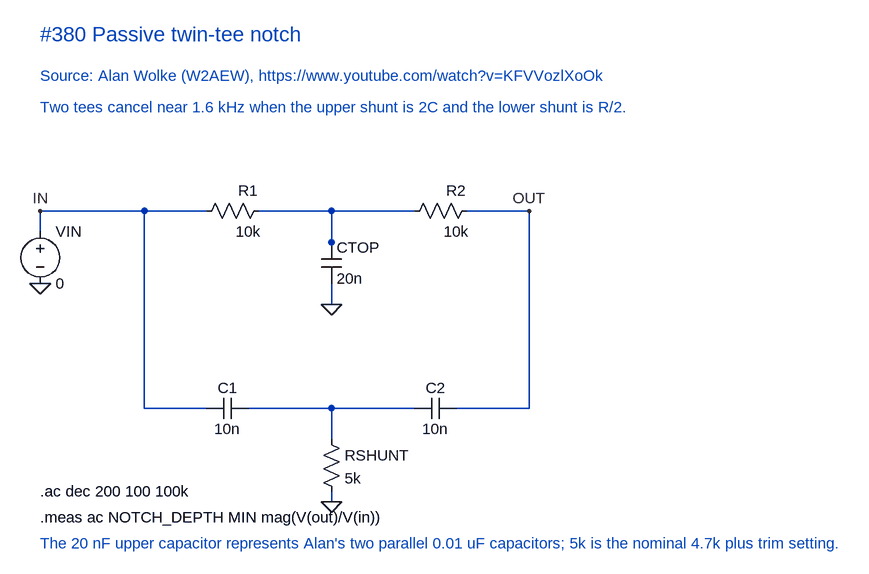
[diagram p0: schematic Passive twin-tee notch.asc]
Passive twin-tee notch.asc, the LTspice schematic file:
Version 4
SHEET 1 1240 880
WIRE 320 288 160 288
WIRE 416 288 320 288
WIRE 608 288 496 288
WIRE 736 288 608 288
WIRE 912 288 816 288
WIRE 912 592 912 288
WIRE 800 592 912 592
WIRE 608 592 736 592
WIRE 480 592 608 592
WIRE 320 592 416 592
WIRE 320 592 320 288
WIRE 608 352 608 288
WIRE 608 432 608 400
WIRE 608 592 608 640
WIRE 608 720 608 736
WIRE 160 288 160 320
FLAG 160 400 0
FLAG 608 432 0
FLAG 608 736 0
FLAG 160 288 IN
FLAG 912 288 OUT
SYMBOL voltage 160 304 R0
SYMATTR InstName VIN
SYMATTR Value 0
SYMATTR SpiceLine AC 1
SYMBOL res 512 272 R90
WINDOW 0 0 32 VBottom 2
WINDOW 3 32 32 VTop 2
SYMATTR InstName R1
SYMATTR Value 10k
SYMBOL res 832 272 R90
WINDOW 0 0 32 VBottom 2
WINDOW 3 32 32 VTop 2
SYMATTR InstName R2
SYMATTR Value 10k
SYMBOL cap 592 336 R0
SYMATTR InstName CTOP
SYMATTR Value 20n
SYMBOL cap 480 576 R90
WINDOW 0 0 32 VBottom 2
WINDOW 3 32 32 VTop 2
SYMATTR InstName C1
SYMATTR Value 10n
SYMBOL cap 800 576 R90
WINDOW 0 0 32 VBottom 2
WINDOW 3 32 32 VTop 2
SYMATTR InstName C2
SYMATTR Value 10n
SYMBOL res 592 624 R0
SYMATTR InstName RSHUNT
SYMATTR Value 5k
TEXT 160 16 Left 3 ;#380 Passive twin-tee notch
TEXT 160 80 Left 2 ;Source: Alan Wolke (W2AEW), https://www.youtube.com/watch?v=KFVVozlXoOk
TEXT 160 128 Left 2 ;Two tees cancel near 1.6 kHz when the upper shunt is 2C and the lower shunt is R/2.
TEXT 160 800 Left 2 ;The 20 nF upper capacitor represents Alan's two parallel 0.01 uF capacitors; 5k is the nominal 4.7k plus trim setting.
TEXT 160 720 Left 2 !.ac dec 200 100 100k
TEXT 160 760 Left 2 !.meas ac NOTCH_DEPTH MIN mag(V(out)/V(in))

The netlist it stands for:
* Passive twin-tee notch.asc
VIN IN 0 0 AC 1
R1 N001 IN 10k
R2 OUT N001 10k
CTOP N001 0 20n
C1 N002 IN 10n
C2 OUT N002 10n
RSHUNT N002 0 5k
* #380 Passive twin-tee notch
* Source: Alan Wolke (W2AEW), https://www.youtube.com/watch?v=KFVVozlXoOk
* Two tees cancel near 1.6 kHz when the upper shunt is 2C and the lower shunt is R/2.
* The 20 nF upper capacitor represents Alan's two parallel 0.01 uF capacitors; 5k is the nominal 4.7k plus trim setting.
.ac dec 200 100 100k
.meas ac NOTCH_DEPTH MIN mag(V(out)/V(in))
.backanno
.end